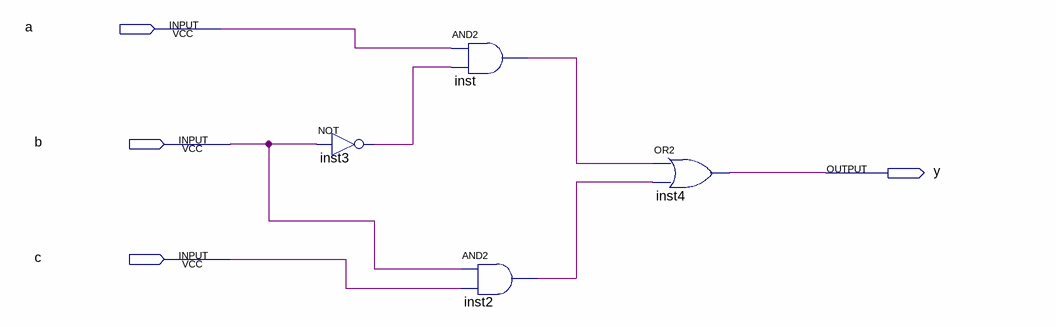
[diagram p0: schematic sheet]
// Quartus schematic Test01.bdf as structural Verilog: 4 symbols, 4 pins
module Test01 (
  input  a,
  input  b,
  input  c,
  output y
);

  wire inst2_out, inst3_out, inst_out;

  not inst3 (inst3_out, b);
  and inst (inst_out, a, inst3_out);
  and inst2 (inst2_out, b, c);
  or inst4 (y, inst_out, inst2_out);
endmodule
